# Altium schematic sheet Power_Sheet.SchDoc
size A4; SheetNumber: 1; SheetTotal: 5
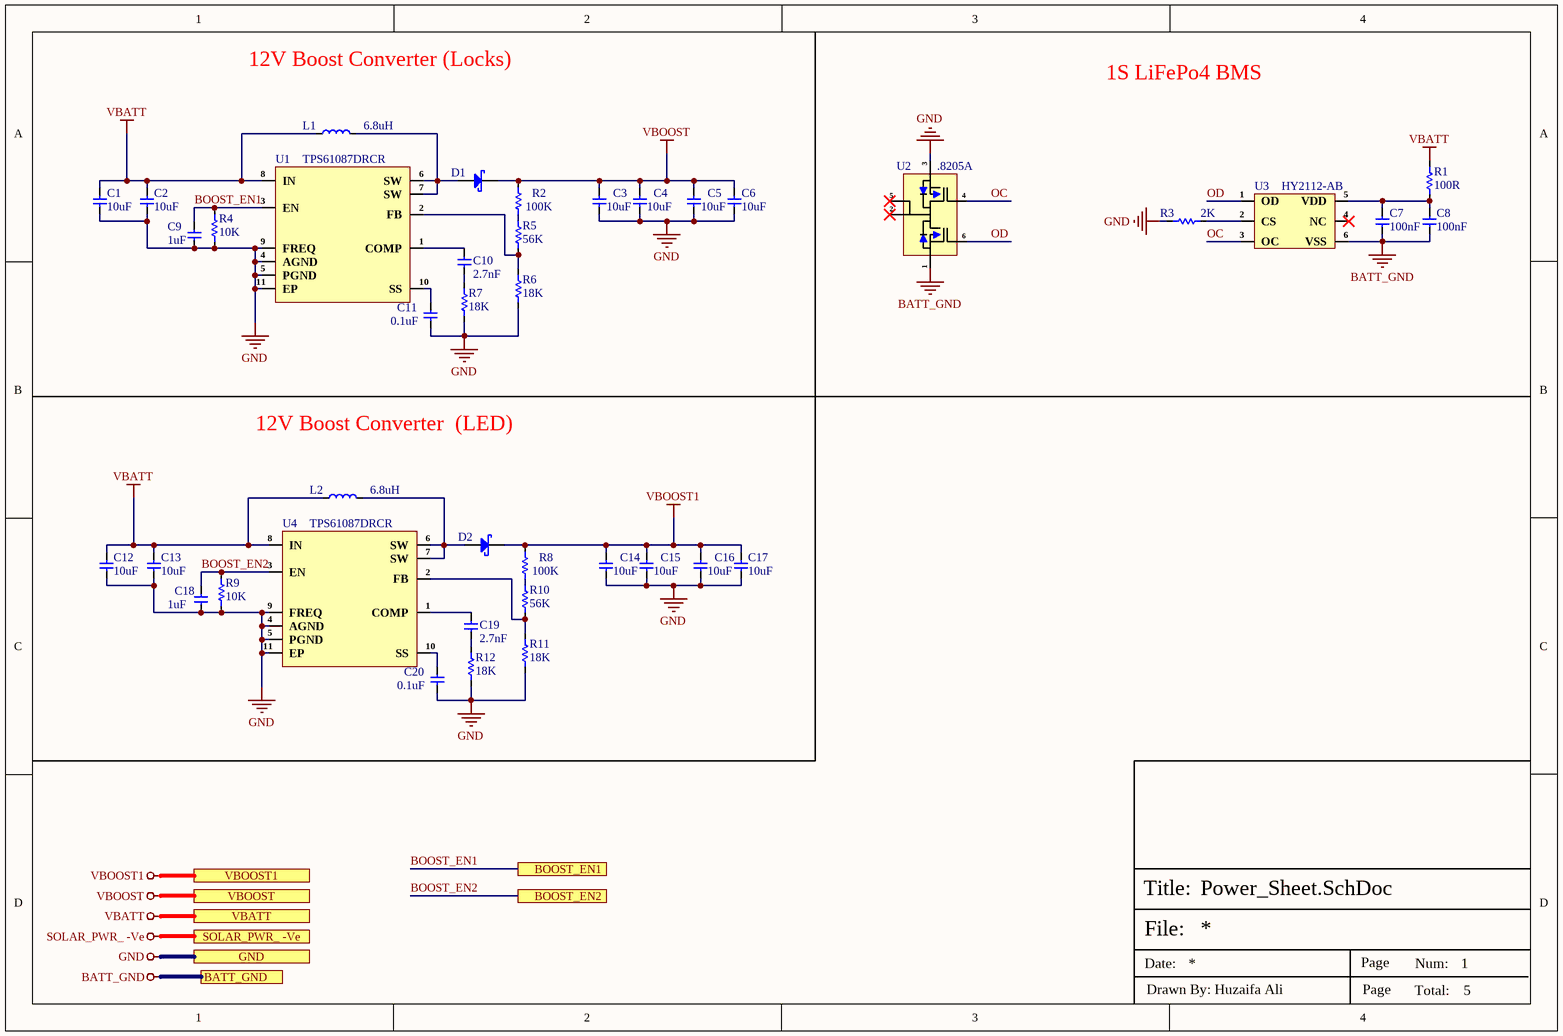
[diagram p0: Power_Sheet.SchDoc]

## Parts
C1  10uF  [Cap-0402]
C2  10uF  [Cap-0402]
C3  10uF  [Cap-0603]
C4  10uF  [Cap-0603]
C5  10uF  [Cap-0603]
C6  10uF  [Cap-0603]
C7  100nF  [Cap-0402]
C8  100nF  [Cap-0402]
C9  1uF  [Cap-0402]
C10  2.7nF  [CAP-0201]
C11  0.1uF  [Cap-0402]
C12  10uF  [Cap-0402]
C13  10uF  [Cap-0402]
C14  10uF  [Cap-0603]
C15  10uF  [Cap-0603]
C16  10uF  [Cap-0603]
C17  10uF  [Cap-0603]
C18  1uF  [Cap-0402]
C19  2.7nF  [CAP-0201]
C20  0.1uF  [Cap-0402]
D1  SL23-E3/52T  [DO-214AA (SMB)]  (value not drawn)
D2  SL23-E3/52T  [DO-214AA (SMB)]  (value not drawn)
L1  6.8uH
L2  6.8uH
R1  100R  [Res-0402]
R2  100K  [Res-0402]
R3  2K  [Res-0402]
R4  10K  [Res-0402]
R5  56K  [Res-0201]
R6  18K  [Res-0402]
R7  18K  [Res-0402]
R8  100K  [Res-0402]
R9  10K  [Res-0402]
R10  56K  [Res-0201]
R11  18K  [Res-0402]
R12  18K  [Res-0402]
U1  TPS61087DRCR  [10-VSON (3x3)]
U2  .8205A  [SOT-23-6]
U3  HY2112-AB  [SOT-23-6]
U4  TPS61087DRCR  [10-VSON (3x3)]

## Ports
BATT_GND, BOOST_EN1, BOOST_EN2, GND, SOLAR_PWR_ -Ve, VBATT, VBOOST, VBOOST1

## Nets
BATT_GND: C7.1 C8.1 U2.1(S1) U3.6(VSS) ; port BATT_GND
GND: C1.1 C2.1 C3.1 C4.1 C5.1 C6.1 C9.1 C11.2 C12.1 C13.1 C14.1 C15.1 C16.1 C17.1 C18.1 C20.2 R3.1 R4.1 R6.1 R7.1 R9.1 R11.1 R12.1 U1.4(AGND) U1.5(PGND) U1.9(FREQ) U1.11(EP) U2.3(S2) U4.4(AGND) U4.5(PGND) U4.9(FREQ) U4.11(EP) ; port GND
SOLAR_PWR_ -Ve: port SOLAR_PWR_ -Ve
VBATT: C1.2 C2.2 C12.2 C13.2 L1.1 L2.1 R1.2 U1.8(IN) U4.8(IN) ; port VBATT
VBOOST: C3.2 C4.2 C5.2 C6.2 D1.1(K) R2.2 ; port VBOOST
VBOOST1: C14.2 C15.2 C16.2 C17.2 D2.1(K) R8.2 ; port VBOOST1
BOOST_EN1: C9.2 R4.2 U1.3(EN) ; port BOOST_EN1
BOOST_EN2: C18.2 R9.2 U4.3(EN) ; port BOOST_EN2
OC: U2.4(G2) U3.3(OC)
OD: U2.6(G1) U3.1(OD)
NetC7_2: C7.2 C8.2 R1.1 U3.5(VDD)
NetC10_1: C10.1 R7.2
NetC10_2: C10.2 U1.1(COMP)
NetC11_1: C11.1 U1.10(SS)
NetC19_1: C19.1 R12.2
NetC19_2: C19.2 U4.1(COMP)
NetC20_1: C20.1 U4.10(SS)
NetD1_2: D1.2(A) L1.2 U1.6(SW) U1.7(SW)
NetD2_2: D2.2(A) L2.2 U4.6(SW) U4.7(SW)
NetR2_1: R2.1 R5.2
NetR3_2: R3.2 U3.2(CS)
NetR5_1: R5.1 R6.2 U1.2(FB)
NetR8_1: R8.1 R10.2
NetR10_1: R10.1 R11.2 U4.2(FB)

Not connected (* = marked no-connect by the designer): U2 2(D)* 5(D)*; U3 4(NC)*

## Notes on the sheet
- 12V Boost Converter (Locks)
- 1S LiFePo4 BMS
- 12V Boost Converter  (LED)
- File:
- Title:
- Date:
- Page
- Num:
- Total:
- Drawn By: Huzaifa Ali

## Library data of the parts
C1 C2 C12 C13 = CC0402MRX5R6BB106: CAP CER 10UF 10V X5R 0402; Manufacturer: Yageo; Tolerance: 20%; Item Type: Capacitor; Supplier 1: Future Electronics; Manufacturer Part Number: CC0402MRX5R6BB106; RoHS: Yes; Category: Ceramic Capacitors; Stock 1: 80000; Pricing 1: 10000=0.02650, 20000=0.02590, 30000=0.02550, 40000=0.02530, 50000=0.02450 (USD); Mount: Surface Mount; Case/Package: 0402; Case Code (Imperial): 0402; Case Code (Metric): 1005; Min Operating Temperature: -55°C; Max Operating Temperature: 85°C; Packaging: Tape and Reel; Capacitance: 10uF; Voltage Rating: 10V; RoHS Compliant: Yes; ComponentLink1URL: http://www.yageo.com/documents/recent/UPY-GPHC_X5R_4V-to-50V_25.pdf?src-supplier=Digi-Key; ComponentLink1Description: http://www.yageo.com/documents/recent/UPY-GPHC_X5R_4V-to-50V_25.pdf?src-supplier=Digi-Key; Supplier Part Number 1: 6097631; LCSC Part Number: C962143
C3-C6 C14-C17 = CL10A106MA8NRNC: CAP CER 10UF 25V X5R 0603; Manufacturer: Samsung; Tolerance: 20%; Supplier 1: Avnet; Manufacturer Part Number: CL10A106MA8NRNC; RoHS: Yes; Category: Ceramic Capacitors; Pricing 1: 4000=0.03753, 8000=0.03700, 16000=0.03595, 24000=0.03515, 32000=0.03383, 40000=0.03304, 400000=0.03225 (USD); Mount: Surface Mount; Case/Package: 0603; Case Code (Metric): 1608; Case Code (Imperial): 0603; Contact Plating: Tin; Min Operating Temperature: -55°C; Max Operating Temperature: 85°C; Package Quantity: 1; Packaging: Tape and Reel; Capacitance: 10uF; Voltage Rating: 25V; Dielectric: X5R; Termination: Wraparound; Series: CL; Construction: Flat; Length: 0.063inch; Width: 0.031inch; Thickness: 0.035inch; Lead Free: Lead Free; RoHS Compliant: Yes; ComponentLink1URL: https://datasheet.ciiva.com/25766/cl10a106ma8nrnc-25766562.pdf?src-supplier=Digi-Key; ComponentLink1Description: https://datasheet.ciiva.com/25766/cl10a106ma8nrnc-25766562.pdf?src-supplier=Digi-Key; Supplier Part Number 1: CL10A106MA8NRNC; LCSC Part Number: C96446
C7 C8 = CC0402KRX5R8BB104: CAP CER 0.1UF 25V X5R 0402; Manufacturer: Yageo; Tolerance: 10%; Item Type: Capacitor; Supplier 1: Digi-Key; Manufacturer Part Number: CC0402KRX5R8BB104; RoHS: Yes; Category: Ceramic Capacitors; Stock 1: 4598218; Pricing 1: 1=0.10000, 10=0.03800, 50=0.02100, 100=0.01710, 500=0.01224, 1000=0.00961, 2500=0.00874, 5000=0.00804 (USD); Mount: Surface Mount; Case/Package: 0402; Case Code (Metric): 1005; Case Code (Imperial): 0402; Min Operating Temperature: -55°C; Max Operating Temperature: 85°C; Voltage Rating: 25V; Packaging: Tape and Reel; Capacitance: 100nF; Voltage Rating (DC): 25V; Dielectric: X5R; Resistor Type: Ceramic; Series: CC; Length: 0.039inch; Width: 0.02inch; Thickness: 0.022inch; Depth: 0.5mm; Lead Free: Lead Free; Halogen Free: Halogen Free; RoHS Compliant: Yes; ComponentLink1URL: http://www.mouser.com/ds/2/447/UPY-GPHC_X5R_4V-to-50V_25-1131599.pdf?src-supplier=Mouser; ComponentLink1Description: http://www.mouser.com/ds/2/447/UPY-GPHC_X5R_4V-to-50V_25-1131599.pdf?src-supplier=Mouser; ComponentLink2URL: http://www.yageo.com/documents/recent/UPY-GPHC_X5R_4V-to-50V-16.pdf?src-supplier=Future+Electronics; ComponentLink2Description: http://www.yageo.com/documents/recent/UPY-GPHC_X5R_4V-to-50V-16.pdf?src-supplier=Future+Electronics; ComponentLink3URL: http://www.yageo.com/documents/recent/UPY-GPHC_X5R_4V-to-50V_25.pdf?src-supplier=Digi-Key; ComponentLink3Description: http://www.yageo.com/documents/recent/UPY-GPHC_X5R_4V-to-50V_25.pdf?src-supplier=Digi-Key; Supplier Part Number 1: 311-1697-1-ND; LCSC Part Number: C106256
C9 C18 = C1005X5R1V105K050BC: CAP CER 1UF 35V X5R 0402; Manufacturer: TDK; Item Type: Capacitors; Dielectric Material: Ceramic; Material: 4241ConductorMaterial; Tolerance: 10%; Supplier: Digikey; Supplier Part Number: 445-9073-1-ND; Manufacturer Part Number: C1005X5R1V105K050BC; RoHS: Yes; Stock: 682645; Pricing: 1=0.15, 10=0.087, 50=0.061, 100=0.0528, 500=0.03898, 1000=0.03468, 2500=0.03011, 5000=0.02735 (USD); Mounting Technology: Surface Mount; Case/Package: 0402; Case Code (Metric): 1005; Case Code (Imperial): 0402; Min Operating Temperature: -55°C; Max Operating Temperature: 85°C; Value: 1uF; Voltage Rating: 35V; Packaging: Tape and Reel; Dielectric: X5R; Series: C; Length: 1mm; Depth: 0.5mm; Radiation Hardening: No; Reach SVHC Compliant: No; Lead Free: Lead Free; RoHS Compliant: Yes; ComponentLink1URL: https://datasheet.ciiva.com/26834/getdatasheetpartid-750449-26834298.pdf?src-supplier=Verical; ComponentLink1Description: https://datasheet.ciiva.com/26834/getdatasheetpartid-750449-26834298.pdf?src-supplier=Verical; ComponentLink2URL: https://datasheet.ciiva.com/28451/1796654-28451087.pdf?src-supplier=Element14; ComponentLink2Description: https://datasheet.ciiva.com/28451/1796654-28451087.pdf?src-supplier=Element14; ComponentLink3URL: https://datasheet.ciiva.com/22719/1796654-22719533.pdf?src-supplier=Element14; ComponentLink3Description: https://datasheet.ciiva.com/22719/1796654-22719533.pdf?src-supplier=Element14
C10 C19 = CC0201KRX7R7BB272: CAP CER 2700PF 16V X7R 0201; Manufacturer: Yageo; Item Type: Capacitors; Material: 4241ConductorMaterial; Tolerance: 10%; Supplier: Digikey; LCSC Part Number: C327026; Manufacturer Part Number: CC0201KRX7R7BB272; RoHS: Yes; Stock: 104705; Pricing: 1=0.1, 10=0.021, 100=0.0129, 1000=0.00737, 2500=0.00572, 5000=0.00494 (USD); Case/Package: 0201; Min Operating Temperature: -55°C; Max Operating Temperature: 85°C; Value: 2.7nF; Dielectric: X7R; Voltage Rating: 16V; Voltage Rating (DC): 16V; Height: 330um; Halogen Free: 5694HalogenFree; Lead Free: 5697LeadFree
C11 C20 = CC0402JRX7R7BB104: CAP CER 0.1UF 16V X7R 0402; Manufacturer: Yageo; Material: 4241ConductorMaterial; Value: 100nF; Tolerance: 5%; Item Type: Capacitor; Supplier: Digikey; Supplier Part Number: 311-1676-1-ND; Manufacturer Part Number: CC0402JRX7R7BB104; RoHS: Yes; Category: Ceramic Capacitors; Stock: 1659111; Pricing: 1=0.1, 10=0.046, 50=0.0262, 100=0.0203, 500=0.01528, 1000=0.012, 2500=0.01091, 5000=0.01004 (USD); Mounting Technology: Surface Mount; Case/Package: 0402; Case Code (Metric): 1005; Case Code (Imperial): 0402; Min Operating Temperature: -55°C; Max Operating Temperature: 125°C; Dielectric: X7R; Packaging: Tape and Reel; Package Quantity: 10000; Voltage Rating (DC): 16V; Voltage Rating: 16V; Series: CC; Construction: Flat; Length: 0.039inch; Width: 0.02inch; Height: 0.5mm; Thickness: 0.022inch; Lead Free: Lead Free; Halogen Free: Halogen Free; RoHS Compliant: Yes; ComponentLink1URL: https://datasheet.ciiva.com/13210/upy-gphc-x7r-6-3v-to-50v-8-12304-13210152.pdf?src-supplier=Mouser; ComponentLink1Description: https://datasheet.ciiva.com/13210/upy-gphc-x7r-6-3v-to-50v-8-12304-13210152.pdf?src-supplier=Mouser; LCSC Part Number: C541464
D1 D2 = SL23-E3/52T: DIODE SCHOTTKY 30V 2A DO214AA; Manufacturer: Vishay Semiconductors; Item Type: Diodes; Supplier: Mouser; LCSC Part Number: C2979790; Manufacturer Part Number: SL23-E3/52T; RoHS: Yes; Stock: 2637; Pricing: 1=0.54, 10=0.363, 50=0.363, 100=0.287, 1000=0.143, 10000=0.128 (USD); ComponentLink1URL: http://www.farnell.com/datasheets/2049348.pdf?src-supplier=Farnell; ComponentLink1Description: http://www.farnell.com/datasheets/2049348.pdf?src-supplier=Farnell; ComponentLink2URL: https://www.alliedelec.com/m/d/b938cf501c2dca4289fb9d630ff5a91d.pdf?src-supplier=Allied+Electronics; ComponentLink2Description: https://www.alliedelec.com/m/d/b938cf501c2dca4289fb9d630ff5a91d.pdf?src-supplier=Allied+Electronics; ComponentLink3URL: http://www.mouser.com/ds/2/427/sl22-108295.pdf?src-supplier=Mouser; ComponentLink3Description: http://www.mouser.com/ds/2/427/sl22-108295.pdf?src-supplier=Mouser; ComponentLink4URL: http://uk.rs-online.com/webdocs/0dcf/0900766b80dcfe9f.pdf?src-supplier=Rs; ComponentLink4Description: http://uk.rs-online.com/webdocs/0dcf/0900766b80dcfe9f.pdf?src-supplier=Rs; ComponentLink5URL: http://components.arrow.com/part/dataview/42820641S9655971N5680?src-supplier=Arrow+Electronics; ComponentLink5Description: http://components.arrow.com/part/dataview/42820641S9655971N5680?src-supplier=Arrow+Electronics; ComponentLink6URL: http://www.produktinfo.conrad.com/datenblaetter/575000-599999/596314-da-01-en-DIODE_SCHOTTKY_SL23_E3_52T_DO_214AA_VIS.pdf?src-supplier=Conrad; ComponentLink6Description: http://www.produktinfo.conrad.com/datenblaetter/575000-599999/596314-da-01-en-DIODE_SCHOTTKY_SL23_E3_52T_DO_214AA_VIS.pdf?src-supplier=Conrad; ComponentLink7URL: https://datasheet.octopart.com/SL23-E3-52T-Vishay-datasheet-8479844.pdf?src-supplier=Farnell; ComponentLink7Description: https://datasheet.octopart.com/SL23-E3-52T-Vishay-datasheet-8479844.pdf?src-supplier=Farnell; ComponentLink8URL: http://www.vishay.com/docs/88741/sl22.pdf?src-supplier=Digikey; ComponentLink8Description: http://www.vishay.com/docs/88741/sl22.pdf?src-supplier=Digikey; ComponentLink9URL: https://www.vishay.com/docs/88741/sl22.pdf?src-supplier=Digikey; ComponentLink9Description: https://www.vishay.com/docs/88741/sl22.pdf?src-supplier=Digikey; ComponentLink10URL: https://datasheet.octopart.com/SL23-E3-52T-Vishay-datasheet-28809157.pdf?src-supplier=Future+Electronics; ComponentLink10Description: https://datasheet.octopart.com/SL23-E3-52T-Vishay-datasheet-28809157.pdf?src-supplier=Future+Electronics; ComponentLink11URL: http://www.vishay.com/docs/88741/88741.pdf?src-supplier=Future+Electronics; ComponentLink11Description: http://www.vishay.com/docs/88741/88741.pdf?src-supplier=Future+Electronics; ComponentLink12URL: http://www.farnell.com/datasheets/2049348.pdf?src-supplier=Element14; ComponentLink12Description: http://www.farnell.com/datasheets/2049348.pdf?src-supplier=Element14; ComponentLink13URL: http://www.vishay.com/docs/88741/88741.pdf?src-supplier=Avnet; ComponentLink13Description: http://www.vishay.com/docs/88741/88741.pdf?src-supplier=Avnet; ComponentLink14URL: https://datasheet.octopart.com/SL23-E3-52T-Vishay-datasheet-11758959.pdf?src-supplier=Element14; ComponentLink14Description: https://datasheet.octopart.com/SL23-E3-52T-Vishay-datasheet-11758959.pdf?src-supplier=Element14; ComponentLink15URL: http://www.farnell.com/datasheets/2243773.pdf?src-supplier=Newark; ComponentLink15Description: http://www.farnell.com/datasheets/2243773.pdf?src-supplier=Newark; ComponentLink16URL: http://docs-usa.electrocomponents.com/techlib:/itc_doclist_US.htm?stockno=7000940&src-supplier=Allied+Electronics; ComponentLink16Description: http://docs-usa.electrocomponents.com/techlib:/itc_doclist_US.htm?stockno=7000940&src-supplier=Allied+Electronics; ComponentLink17URL: https://datasheet.octopart.com/SL23-E3-52T-Vishay-datasheet-124739981.pdf?src-supplier=TME; ComponentLink17Description: https://datasheet.octopart.com/SL23-E3-52T-Vishay-datasheet-124739981.pdf?src-supplier=TME
L1 L2 = CDRH6D26HPNP-6R8PC: 6.8 µH Shielded Drum Core, Wirewound Inductor 2.3 A 64.4mOhm Max Nonstandard; Manufacturer: Sumida; Supplier: DigiKey; LCSC Part Number: C212266; Manufacturer Part Number: CDRH6D26HPNP-6R8PC; RoHS: Yes; Item Type: Inductor
R1 = RC0402FR-07100RL: RES 100 OHM 1% 1/16W 0402; Manufacturer: Yageo; Power Rating: 62.5mW; Voltage Rating: 50V; Temperature Coefficient: 100ppm/°C; Max Power Dissipation: 63mW; Item Type: Resistor; Supplier 1: Mouser; Manufacturer Part Number: RC0402FR-07100RL; RoHS: Yes; Category: Chip SMD Resistors; Stock 1: 699545; Pricing 1: 1=0.10000, 10=0.01200, 50=0.01200, 100=0.00500, 1000=0.00300, 2500=0.00200, 10000=0.00100 (USD); Case/Package: 0402; Number of Pins: 2; Case Code (Imperial): 0402; Case Code (Metric): 1005; Size Code: 0402; Min Operating Temperature: -55°C; Max Operating Temperature: 155°C; Tolerance: 1%; Voltage Rating (DC): 50V; Resistance: 100R; Packaging: Tape and Reel; Termination: SMD/SMT; Resistor Type: Thick Film; Features: Moisture Resistant; Series: RC; Number of Terminations: 2; Resistance Tolerance: 1%; Construction: Rectangular; Technology: THICK FILM; Length: 1mm; Width: 0.5mm; Height: 0.32mm; Depth: 0.5mm; RoHS Compliant: Yes; REACH SVHC: No SVHC; Military Standard: Not; Lead Free: Lead Free; ComponentLink1URL: https://datasheet.ciiva.com/11808/0900766b80c66297-11808765.pdf?src-supplier=RSComponents; ComponentLink1Description: https://datasheet.ciiva.com/11808/0900766b80c66297-11808765.pdf?src-supplier=RSComponents; ComponentLink2URL: https://datasheet.ciiva.com/7849/1784430-7849810.pdf?src-supplier=Element14; ComponentLink2Description: https://datasheet.ciiva.com/7849/1784430-7849810.pdf?src-supplier=Element14; ComponentLink3URL: https://datasheet.ciiva.com/28367/1018594-28367226.pdf?src-supplier=Element14; ComponentLink3Description: https://datasheet.ciiva.com/28367/1018594-28367226.pdf?src-supplier=Element14; ComponentLink4URL: https://datasheet.ciiva.com/22747/1018594-22747511.pdf?src-supplier=Element14; ComponentLink4Description: https://datasheet.ciiva.com/22747/1018594-22747511.pdf?src-supplier=Element14; ComponentLink5URL: https://datasheet.ciiva.com/12667/pyu-rc0402-51-rohs-l-6-r-12667957.pdf?src-supplier=Mouser; ComponentLink5Description: https://datasheet.ciiva.com/12667/pyu-rc0402-51-rohs-l-6-r-12667957.pdf?src-supplier=Mouser; ComponentLink6URL: https://datasheet.ciiva.com/15189/getdatasheetpartid-329466-15189335.pdf?src-supplier=Verical; ComponentLink6Description: https://datasheet.ciiva.com/15189/getdatasheetpartid-329466-15189335.pdf?src-supplier=Verical; ComponentLink7URL: https://datasheet.ciiva.com/16740/pyu-rc0402-51-rohs-l-6-r-16740566.pdf?src-supplier=Future+Electronics; ComponentLink7Description: https://datasheet.ciiva.com/16740/pyu-rc0402-51-rohs-l-6-r-16740566.pdf?src-supplier=Future+Electronics; Supplier Part Number 1: 603-RC0402FR-07100RL; LCSC Part Number: C106232
R2 R8 = RC0402FR-07100KL: RES 100K OHM 1% 1/16W 0402; Manufacturer: Yageo; Resistance: 100kR; Temperature Coefficient: 100ppm/°C; Power Rating: 63mW; Voltage Rating: 50V; Item Type: Resistor; Supplier 1: Mouser; Manufacturer Part Number: RC0402FR-07100KL; RoHS: Yes; Category: Chip SMD Resistors; Stock 1: 7759549; Pricing 1: 1=0.10000, 10=0.01200, 50=0.01200, 100=0.00500, 1000=0.00300, 2500=0.00200, 10000=0.00100 (USD); Case/Package: 0402; Case Code (Metric): 1005; Case Code (Imperial): 0402; Min Operating Temperature: -55°C; Max Operating Temperature: 155°C; Resistor Type: Thick Film; Tolerance: 1%; Packaging: Tape and Reel; Package Quantity: 1; Number of Terminations: 2; Termination: SMD/SMT; Max Power Dissipation: 63mW; Working Voltage: 50V; Features: Moisture Resistant; Series: RC; Resistance Tolerance: 1%; Construction: Rectangular; Technology: THICK FILM; Length: 0.039inch; Width: 0.02inch; Height: 0.016inch; Depth: 0.5mm; REACH SVHC: No SVHC; Lead Free: Lead Free; RoHS Compliant: Yes; Military Standard: Not; ComponentLink1URL: https://datasheet.ciiva.com/11819/0900766b80c66297-11819452.pdf?src-supplier=RSComponents; ComponentLink1Description: https://datasheet.ciiva.com/11819/0900766b80c66297-11819452.pdf?src-supplier=RSComponents; ComponentLink2URL: https://datasheet.ciiva.com/22747/1018594-22747509.pdf?src-supplier=Element14; ComponentLink2Description: https://datasheet.ciiva.com/22747/1018594-22747509.pdf?src-supplier=Element14; ComponentLink3URL: https://datasheet.ciiva.com/2453/pyu-r-int-thick-7-2453362.pdf?src-supplier=Digi-Key; ComponentLink3Description: https://datasheet.ciiva.com/2453/pyu-r-int-thick-7-2453362.pdf?src-supplier=Digi-Key; ComponentLink4URL: https://datasheet.ciiva.com/2453/pyu-r-int-thick-7-2453363.pdf?src-supplier=Digi-Key; ComponentLink4Description: https://datasheet.ciiva.com/2453/pyu-r-int-thick-7-2453363.pdf?src-supplier=Digi-Key; ComponentLink5URL: https://datasheet.ciiva.com/2453/pyu-r-int-thick-7-2453361.pdf?src-supplier=Digi-Key; ComponentLink5Description: https://datasheet.ciiva.com/2453/pyu-r-int-thick-7-2453361.pdf?src-supplier=Digi-Key; ComponentLink6URL: https://datasheet.ciiva.com/12667/pyu-rc0402-51-rohs-l-6-r-12667930.pdf?src-supplier=Mouser; ComponentLink6Description: https://datasheet.ciiva.com/12667/pyu-rc0402-51-rohs-l-6-r-12667930.pdf?src-supplier=Mouser; ComponentLink7URL: https://datasheet.ciiva.com/15189/getdatasheetpartid-323696-15189334.pdf?src-supplier=Verical; ComponentLink7Description: https://datasheet.ciiva.com/15189/getdatasheetpartid-323696-15189334.pdf?src-supplier=Verical; Supplier Part Number 1: 603-RC0402FR-07100KL; LCSC Part Number: C60491
R3 = RC0402FR-072KL: RES 2K OHM 1% 1/16W 0402; Manufacturer: Yageo; Item Type: Resistor; Value: 2kR; Power Rating: 63mW; Voltage Rating: 50V; Temperature Coefficient: 100ppm/°C; LCSC Part Number: C60488; ComponentLink2URL: https://datasheet.ciiva.com/11808/0900766b80c66297-11808787.pdf?src-supplier=Rs; ComponentLink2Description: https://datasheet.ciiva.com/11808/0900766b80c66297-11808787.pdf?src-supplier=Rs; ComponentLink3URL: https://datasheet.ciiva.com/7849/1018594-7849934.pdf?src-supplier=Element14; ComponentLink3Description: https://datasheet.ciiva.com/7849/1018594-7849934.pdf?src-supplier=Element14; ComponentLink4URL: https://datasheet.ciiva.com/7849/1018594-7849935.pdf?src-supplier=Element14; ComponentLink4Description: https://datasheet.ciiva.com/7849/1018594-7849935.pdf?src-supplier=Element14; ComponentLink5URL: https://datasheet.ciiva.com/7983/1018594-7983517.pdf?src-supplier=Element14; ComponentLink5Description: https://datasheet.ciiva.com/7983/1018594-7983517.pdf?src-supplier=Element14; ComponentLink6URL: https://datasheet.ciiva.com/2453/pyu-r-int-thick-7-2453635.pdf?src-supplier=Digi-Key; ComponentLink6Description: https://datasheet.ciiva.com/2453/pyu-r-int-thick-7-2453635.pdf?src-supplier=Digi-Key; ComponentLink7URL: https://datasheet.ciiva.com/2453/pyu-r-int-thick-7-2453636.pdf?src-supplier=Digi-Key; ComponentLink7Description: https://datasheet.ciiva.com/2453/pyu-r-int-thick-7-2453636.pdf?src-supplier=Digi-Key; ComponentLink8URL: https://datasheet.ciiva.com/2453/pyu-r-int-thick-7-2453634.pdf?src-supplier=Digi-Key; ComponentLink8Description: https://datasheet.ciiva.com/2453/pyu-r-int-thick-7-2453634.pdf?src-supplier=Digi-Key; ComponentLink9URL: https://datasheet.ciiva.com/12667/pyu-rc0402-51-rohs-l-6-r-12667451.pdf?src-supplier=Mouser; ComponentLink9Description: https://datasheet.ciiva.com/12667/pyu-rc0402-51-rohs-l-6-r-12667451.pdf?src-supplier=Mouser; ComponentLink10URL: https://datasheet.ciiva.com/15189/getdatasheetpartid-358921-15189414.pdf?src-supplier=Verical; ComponentLink10Description: https://datasheet.ciiva.com/15189/getdatasheetpartid-358921-15189414.pdf?src-supplier=Verical; Supplier: Future Electronics; Supplier Part Number: 7970452; Manufacturer Part Number: RC0402FR-072KL; RoHS: Yes; Category: Chip SMD Resistors; Stock: 8530000; Pricing: 10000=0.0018, 100000=0.0011, 200000=0.0017, 300000=0.001, 750000=0.0016, 2000000=0.0009, 2500000=0.0016, 10000000=0.0014 (USD); Case/Package: 0402; Case Code (Metric): 1005; Case Code (Imperial): 0402; Min Operating Temperature: -55°C; Max Operating Temperature: 155°C; Resistor Type: Thick Film; Tolerance: 1%; Package Quantity: 1; Packaging: Tape and Reel; Number of Terminations: 2; Termination: SMD/SMT; Max Power Dissipation: 63mW; Working Voltage: 50V; Features: Moisture Resistant; Series: RC; Technology: THICK FILM; Construction: Rectangular; Resistance Tolerance: 1%; Voltage Rating (DC): 50V; Length: 0.039inch; Width: 0.02inch; Height: 0.016inch; Depth: 0.5mm; RoHS Compliant: Yes; Military Standard: Not; Reach SVHC Compliant: Unknown; Lead Free: 5697LeadFree; ComponentLink1URL: https://datasheet.ciiva.com/11808/0900766b80c66297-11808787.pdf?src-supplier=Rs; ComponentLink1Description: https://datasheet.ciiva.com/11808/0900766b80c66297-11808787.pdf?src-supplier=Rs; ComponentLink11URL: https://datasheet.ciiva.com/2453/pyu-r-int-thick-7-2453635.pdf?src-supplier=Digikey; ComponentLink11Description: https://datasheet.ciiva.com/2453/pyu-r-int-thick-7-2453635.pdf?src-supplier=Digikey; ComponentLink12URL: https://datasheet.ciiva.com/2453/pyu-r-int-thick-7-2453636.pdf?src-supplier=Digikey; ComponentLink12Description: https://datasheet.ciiva.com/2453/pyu-r-int-thick-7-2453636.pdf?src-supplier=Digikey; ComponentLink13URL: https://datasheet.ciiva.com/2453/pyu-r-int-thick-7-2453634.pdf?src-supplier=Digikey; ComponentLink13Description: https://datasheet.ciiva.com/2453/pyu-r-int-thick-7-2453634.pdf?src-supplier=Digikey
R4 R9 = RE0402DRE0710KL: RES SMD 10K OHM 0.5% 1/16W 0402; Manufacturer: Yageo; Value: 10kR; Max Power Dissipation: 63mW; Temperature Coefficient: 50ppm/°C; Item Type: Resistor; Supplier: Future Electronics; Supplier Part Number: 8132697; Manufacturer Part Number: RE0402DRE0710KL; RoHS: Yes; Category: Chip SMD Resistors; Stock: 10000; Pricing: 10000=0.0059, 40000=0.0056, 150000=0.0053, 250000=0.0052, 500000=0.0049 (USD); Case/Package: 0402; Min Operating Temperature: -55°C; Max Operating Temperature: 155°C; Packaging: Tape and Reel; Number of Terminations: 2; Tolerance: 0.5%; Features: Moisture Resistant; Series: RE; Length: 0.039inch; Width: 0.02inch; Height: 0.015inch; RoHS Compliant: Yes; ComponentLink1URL: http://www.yageo.com/NewPortal/yageodocoutput?fileName=/pdf/R-Chip/PYu-RE_105_RoHS_L_6.pdf&src-supplier=Digi-Key; ComponentLink1Description: http://www.yageo.com/NewPortal/yageodocoutput?fileName=/pdf/R-Chip/PYu-RE_105_RoHS_L_6.pdf&src-supplier=Digi-Key; LCSC Part Number: C851874
R5 R10 = RC0201DR-0756KL: RES 56K OHM 0.5% 1/20W 0201; Manufacturer: Yageo; Item Type: Resistors; Value: 56kR; Max Power Dissipation: 50mW; Temperature Coefficient: 200ppm/°C; Supplier: Digikey; LCSC Part Number: C851761; Manufacturer Part Number: RC0201DR-0756KL; RoHS: Yes; Pricing: 10000=0.02201 (USD); Case/Package: 0201; Min Operating Temperature: -55°C; Max Operating Temperature: 125°C; Packaging: Tape and Reel; Number of Terminations: 2; Tolerance: 0.5%; Features: Moisture Resistant; Series: RC; Length: 0.024inch; Width: 0.012inch; Height: 0.01inch; RoHS Compliant: Yes; ComponentLink1URL: http://www.yageo.com.tw/exep/pages/download/literatures/PYu-R_INT-thick_7.pdf?src-supplier=Digikey; ComponentLink1Description: http://www.yageo.com.tw/exep/pages/download/literatures/PYu-R_INT-thick_7.pdf?src-supplier=Digikey
R6 R7 R11 R12 = RT0402BRD0718KL: RES SMD 18K OHM 0.1% 1/16W 0402; Manufacturer: Yageo; Value: 18kR; Power Rating: 62.5mW; Voltage Rating: 50V; Max Power Dissipation: 63mW; Temperature Coefficient: 25ppm/°C; Item Type: Resistor; Supplier: Future Electronics; Supplier Part Number: 4031418; Manufacturer Part Number: RT0402BRD0718KL; RoHS: Yes; Category: Chip SMD Resistors; Stock: 120000; Pricing: 10000=0.02, 20000=0.0196, 40000=0.0191, 50000=0.019, 150000=0.0181 (USD); Case/Package: 0402; Case Code (Metric): 1005; Case Code (Imperial): 0402; Weight: 2.3E-05oz; Min Operating Temperature: -55°C; Max Operating Temperature: 155°C; Package Quantity: 10000; Packaging: Tape and Reel; Tolerance: 0.1%; Number of Terminations: 2; Termination: SMD/SMT; Voltage Rating (DC): 50V; Series: RT; Length: 0.039inch; Width: 0.5mm; Height: 0.014inch; Lead Free: Lead Free; RoHS Compliant: Yes; ComponentLink1URL: https://datasheet.ciiva.com/12798/pyu-rt-1-to-0-05-rohs-l-4-12798951.pdf?src-supplier=Mouser; ComponentLink1Description: https://datasheet.ciiva.com/12798/pyu-rt-1-to-0-05-rohs-l-4-12798951.pdf?src-supplier=Mouser; ComponentLink2URL: https://datasheet.ciiva.com/2582/pyu-rt-1-to-0-05-rohs-l-5-2582178.pdf?src-supplier=Digi-Key; ComponentLink2Description: https://datasheet.ciiva.com/2582/pyu-rt-1-to-0-05-rohs-l-5-2582178.pdf?src-supplier=Digi-Key; LCSC Part Number: C852579
U1 U4 = TPS61087DRCR: IC REG BOOST ADJ 3.2A 10VSON; Manufacturer: Texas Instruments; Number of Channels: 1NUMBER; Supplier: Mouser; LCSC Part Number: C112172; Manufacturer Part Number: TPS61087DRCR; RoHS: Yes; Item Type: IC; Stock: 3146; Pricing: 1=2.05, 10=1.52, 50=1.38, 100=1.24, 1000=1.09, 10000=0.994 (USD); Length: 3mm; Height: 1mm; Thickness: 900um; ComponentLink1URL: https://datasheet.ciiva.com/15113/getdatasheetpartid-203567-15113836.pdf?src-supplier=Verical; ComponentLink1Description: https://datasheet.ciiva.com/15113/getdatasheetpartid-203567-15113836.pdf?src-supplier=Verical; ComponentLink2URL: https://datasheet.ciiva.com/2025/tps61087-2025888.pdf?src-supplier=Digikey; ComponentLink2Description: https://datasheet.ciiva.com/2025/tps61087-2025888.pdf?src-supplier=Digikey; ComponentLink3URL: https://datasheet.ciiva.com/41462/001014888-da-01-en-ic-reg-boost-ad-tps61087drcr-vson-10-tid-41462734.pdf?src-supplier=Conrad; ComponentLink3Description: https://datasheet.ciiva.com/41462/001014888-da-01-en-ic-reg-boost-ad-tps61087drcr-vson-10-tid-41462734.pdf?src-supplier=Conrad; ComponentLink4URL: https://datasheet.ciiva.com/2025/tps61087-2025889.pdf?src-supplier=Digikey; ComponentLink4Description: https://datasheet.ciiva.com/2025/tps61087-2025889.pdf?src-supplier=Digikey; ComponentLink5URL: https://datasheet.ciiva.com/2025/tps61087-2025890.pdf?src-supplier=Digikey; ComponentLink5Description: https://datasheet.ciiva.com/2025/tps61087-2025890.pdf?src-supplier=Digikey
U2 = .8205A: 20V 6A 22mΩ@4.5V,4.5A 2W 2PCSNChannel(Common Drain) SOT-23-6 MOSFETs ROHS; Manufacturer: Shenzhen Fuman Elec; Item Type: IC; ComponentLink1Description: LCSC; ComponentLink1URL: https://www.lcsc.com/product-detail/MOSFETs_Shenzhen-Fuman-Elec-8205A_C841290.html; Manufacturer Part Number: .8205A; Package: SOT-23-6; LCSC Part Number: C841290
U3 = HY2112-AB: SOT-23-6 Battery Management ROHS; Manufacturer: HYCON Tech; Item Type: IC; Manufacturer Part Number: HY2112-AB; Package: SOT-23-6; LCSC Part Number: C168763; ComponentLink1Description: LCSC; ComponentLink1URL: https://www.lcsc.com/product-detail/Battery-Management_HYCON-Tech-HY2112-AB_C168763.html?s_z=n_HY2112